# Altium schematic sheet FPGA.SchDoc: =DocumentName
size A4; DocumentNumber: 1; Revision: 0; SheetNumber: 15; SheetTotal: 30
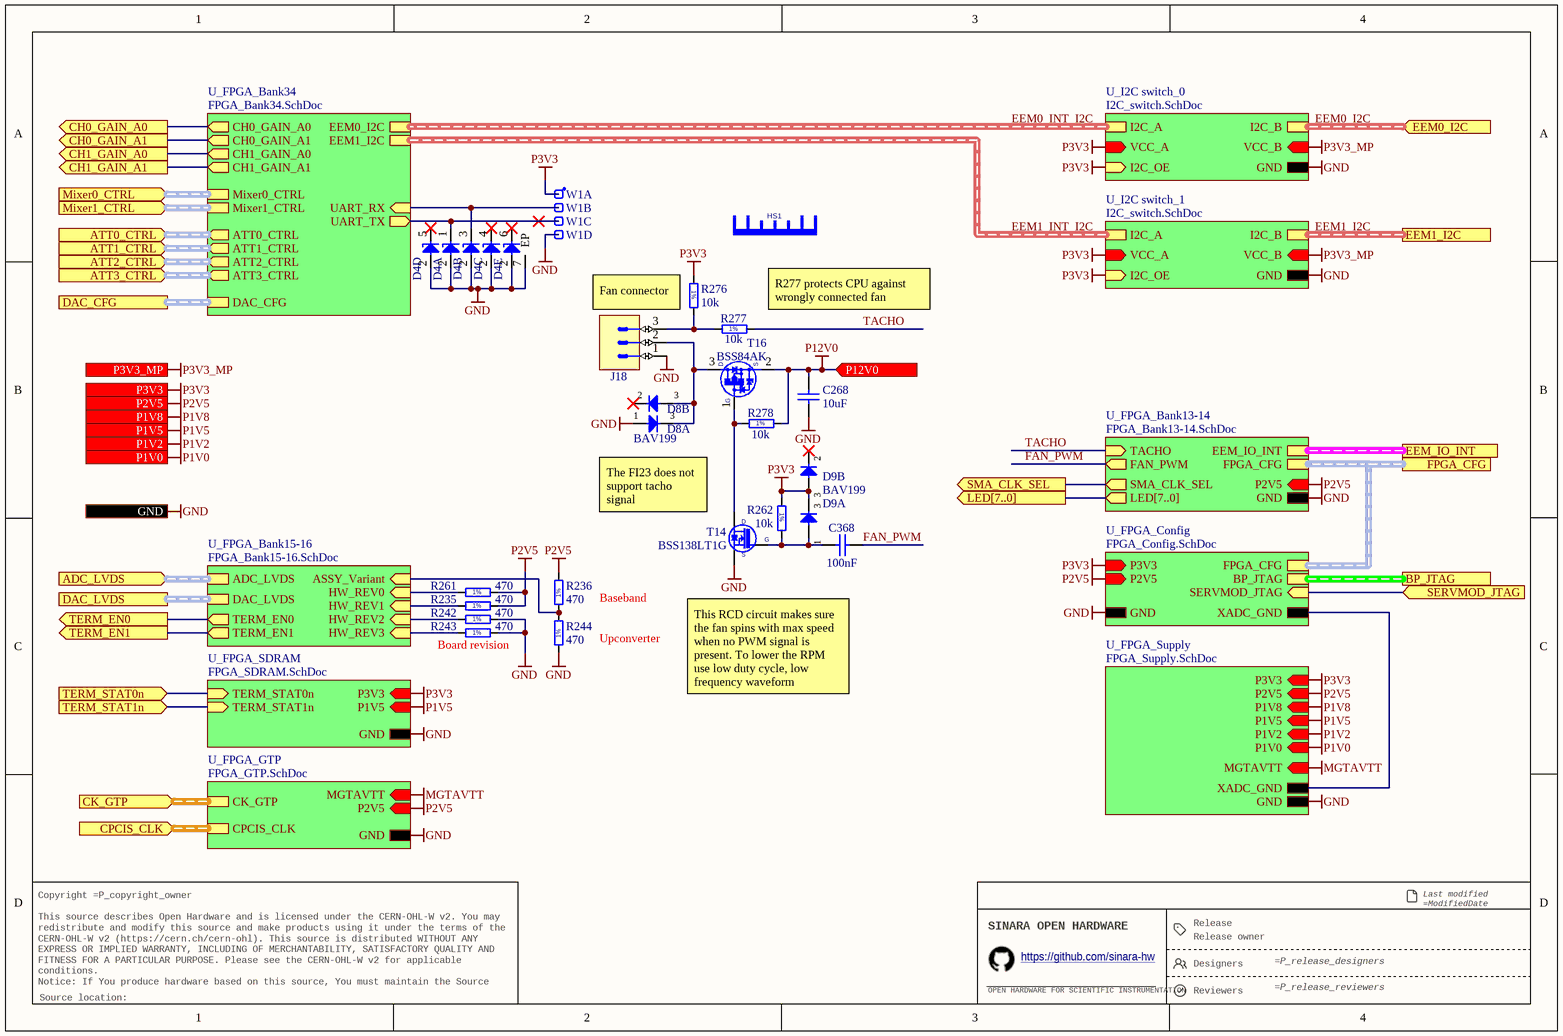
[diagram p0: FPGA.SchDoc]

## Parts
C268  10uF  [CAPC2012X95N]
C368  100nF  [CAPC0603X33N]
D4  UCLAMP3305P.TCT  [SON50P160X65_HS-7N]  (value not drawn)  (parts A,B,C,D,E of 5)
D8  BAV199  [SOT95P240X110-3N]  (parts A,B of 2)
D9  BAV199  [SOT95P240X110-3N]  (parts A,B of 2)
HS1  RADIAN_FI23  [RADIAN_FI23]  (value not drawn)
J18  KK®  [MOLEX_22-27-2031]  (value not drawn)
R235  470  [RESC1005X40N]
R236  470  [RESC1005X40N]
R242  470  [RESC1005X40N]
R243  470  [RESC1005X40N]
R244  470  [RESC1005X40N]
R261  470  [RESC1005X40N]
R262  10k  [RESC1005X40N]
R276  10k  [RESC1005X40N]
R277  10k  [RESC1005X40N]
R278  10k  [RESC1005X40N]
T14  BSS138LT1G  [SOT95P240X110-3N]
T16  BSS84AK  [SOT95P230X110-3N]
W1  Header 4  [SAMTEC_HTSW-104-23-L-S]  (value not drawn)  (parts A,B,C,D of 4)

## Sub-sheets
U_FPGA_Bank13-14 = FPGA_Bank13-14.SchDoc: GND, P2V5 (in), SMA_CLK_SEL (out), EEM_IO_INT (harness EEM_LVDS), FPGA_CFG (harness FPGA_CFG), TACHO (in), FAN_PWM (out), LED[7..0] (out)
U_FPGA_Bank15-16 = FPGA_Bank15-16.SchDoc: DAC_LVDS (harness DAC_LVDS), ADC_LVDS (harness ADC_LVDS), ASSY_Variant (in), HW_REV1 (in), HW_REV2 (in), HW_REV0 (in), HW_REV3 (in), TERM_EN0 (out), TERM_EN1 (out)
U_FPGA_Bank34 = FPGA_Bank34.SchDoc: CH0_GAIN_A0 (out), CH0_GAIN_A1 (out), CH1_GAIN_A0 (out), CH1_GAIN_A1 (out), Mixer1_CTRL (harness Mixer_CTRL), Mixer0_CTRL (harness Mixer_CTRL), ATT0_CTRL (out, harness ATT_CTRL), DAC_CFG (harness DAC_CFG), EEM1_I2C (harness I2C), EEM0_I2C (harness I2C), UART_RX (in), UART_TX (out), ATT1_CTRL (out, harness ATT_CTRL), ATT2_CTRL (out, harness ATT_CTRL), ATT3_CTRL (out, harness ATT_CTRL)
U_FPGA_Config = FPGA_Config.SchDoc: GND, XADC_GND, SERVMOD_JTAG (in), FPGA_CFG (harness FPGA_CFG), BP_JTAG (harness BP_JTAG), P3V3 (in), P2V5 (in)
U_FPGA_GTP = FPGA_GTP.SchDoc: GND, MGTAVTT (in), P2V5 (in), CK_GTP (harness CLK_DIFF), CPCIS_CLK (harness CLK_DIFF)
U_FPGA_SDRAM = FPGA_SDRAM.SchDoc: GND, P3V3 (in), P1V5 (in), TERM_STAT0n (in), TERM_STAT1n (in)
U_FPGA_Supply = FPGA_Supply.SchDoc: P3V3 (in), P1V8 (in), P1V5 (in), P2V5 (in), P1V2 (in), P1V0 (in), GND, MGTAVTT (in), XADC_GND
U_I2C switch_0 = I2C_switch.SchDoc: I2C_A (harness I2C), I2C_B (harness I2C), I2C_OE (in), GND, VCC_A (in), VCC_B (in)
U_I2C switch_1 = I2C_switch.SchDoc: I2C_A (harness I2C), I2C_B (harness I2C), I2C_OE (in), GND, VCC_A (in), VCC_B (in)

## Ports
ADC_LVDS (in, harness ADC_LVDS), ATT0_CTRL (in, harness ATT_CTRL), ATT1_CTRL (in, harness ATT_CTRL), ATT2_CTRL (in, harness ATT_CTRL), ATT3_CTRL (in, harness ATT_CTRL), BP_JTAG (harness BP_JTAG), CH0_GAIN_A0 (out), CH0_GAIN_A1 (out), CH1_GAIN_A0 (out), CH1_GAIN_A1 (out), CK_GTP (in, harness CLK_DIFF), CPCIS_CLK (in, harness CLK_DIFF), DAC_CFG (harness DAC_CFG), DAC_LVDS (harness DAC_LVDS), EEM0_I2C (in, harness I2C), EEM1_I2C (harness I2C), EEM_IO_INT (harness EEM_LVDS), FPGA_CFG (harness FPGA_CFG), GND, LED[7..0] (out), Mixer0_CTRL (in, harness Mixer_CTRL), Mixer1_CTRL (in, harness Mixer_CTRL), P1V0 (in), P1V2 (in), P1V5 (in), P1V8 (in), P2V5 (in), P3V3 (in), P3V3_MP (in), P12V0 (in), SERVMOD_JTAG (in), SMA_CLK_SEL (out), TERM_EN0 (out), TERM_EN1 (out), TERM_STAT0n (in), TERM_STAT1n (in)

## Nets
GND: C268.1 D4.2(A) D4.7(EP) D8.1(A) J18.1 R242.2 R243.2 R244.1 T14.2(S) W1.4 ; port GND, sheet U_FPGA_Bank13-14/GND, sheet U_FPGA_Supply/GND, sheet U_FPGA_Config/GND, sheet U_FPGA_SDRAM/GND, sheet U_FPGA_GTP/GND, sheet U_I2C switch_0/GND, sheet U_I2C switch_1/GND
MGTAVTT: sheet U_FPGA_Supply/MGTAVTT, sheet U_FPGA_GTP/MGTAVTT
P1V0: port P1V0, sheet U_FPGA_Supply/P1V0
P1V2: port P1V2, sheet U_FPGA_Supply/P1V2
P1V5: port P1V5, sheet U_FPGA_Supply/P1V5, sheet U_FPGA_SDRAM/P1V5
P1V8: port P1V8, sheet U_FPGA_Supply/P1V8
P2V5: R235.2 R236.2 R261.2 ; port P2V5, sheet U_FPGA_Bank13-14/P2V5, sheet U_FPGA_Supply/P2V5, sheet U_FPGA_Config/P2V5, sheet U_FPGA_GTP/P2V5
P3V3: D9.3(COMAC) R262.1 R276.1 W1.1 ; port P3V3, sheet U_FPGA_Supply/P3V3, sheet U_FPGA_Config/P3V3, sheet U_FPGA_SDRAM/P3V3, sheet U_I2C switch_0/I2C_OE, sheet U_I2C switch_0/VCC_A, sheet U_I2C switch_1/I2C_OE, sheet U_I2C switch_1/VCC_A
P3V3_MP: port P3V3_MP, sheet U_I2C switch_0/VCC_B, sheet U_I2C switch_1/VCC_B
P12V0: C268.2 R278.1 T16.2(S) ; port P12V0
CH0_GAIN_A0: port CH0_GAIN_A0, sheet U_FPGA_Bank34/CH0_GAIN_A0
CH0_GAIN_A1: port CH0_GAIN_A1, sheet U_FPGA_Bank34/CH0_GAIN_A1
CH1_GAIN_A0: port CH1_GAIN_A0, sheet U_FPGA_Bank34/CH1_GAIN_A0
CH1_GAIN_A1: port CH1_GAIN_A1, sheet U_FPGA_Bank34/CH1_GAIN_A1
FAN_PWM: C368.2 ; sheet U_FPGA_Bank13-14/FAN_PWM
SERVMOD_JTAG: port SERVMOD_JTAG, sheet U_FPGA_Config/SERVMOD_JTAG
SMA_CLK_SEL: port SMA_CLK_SEL, sheet U_FPGA_Bank13-14/SMA_CLK_SEL
TACHO: R277.2 ; sheet U_FPGA_Bank13-14/TACHO
TERM_EN0: port TERM_EN0, sheet U_FPGA_Bank15-16/TERM_EN0
TERM_EN1: port TERM_EN1, sheet U_FPGA_Bank15-16/TERM_EN1
TERM_STAT0n: port TERM_STAT0n, sheet U_FPGA_SDRAM/TERM_STAT0n
TERM_STAT1n: port TERM_STAT1n, sheet U_FPGA_SDRAM/TERM_STAT1n
NetC368_1: C368.1 D9.1(A) R262.2 T14.1(G)
NetD4_1: D4.1(C) W1.3 ; sheet U_FPGA_Bank34/UART_TX
NetD4_3: D4.3(C) W1.2 ; sheet U_FPGA_Bank34/UART_RX
NetD8_3: D8.3(COMAC) J18.2 T16.3(D)
NetJ18_3: J18.3 R276.2 R277.1
NetR235_1: R235.1 ; sheet U_FPGA_Bank15-16/HW_REV1
NetR236_1: R236.1 R244.2 ; sheet U_FPGA_Bank15-16/ASSY_Variant
NetR242_1: R242.1 ; sheet U_FPGA_Bank15-16/HW_REV2
NetR243_1: R243.1 ; sheet U_FPGA_Bank15-16/HW_REV3
NetR261_1: R261.1 ; sheet U_FPGA_Bank15-16/HW_REV0
NetR278_2: R278.2 T14.3(D) T16.1(G)
(unnamed): sheet U_FPGA_Supply/XADC_GND, sheet U_FPGA_Config/XADC_GND

Not connected (* = marked no-connect by the designer): D4 4(C)* 5(C)* 6(C)*; D8 2(C)*; D9 2(C)*

## Buses and harness runs
bus port LED[7..0] = sheet U_FPGA_Bank13-14/LED[7..0]
harness EEM0_I2C = port EEM0_I2C = sheet U_I2C switch_0/I2C_B
harness EEM0_INT_I2C = sheet U_FPGA_Bank34/EEM0_I2C = sheet U_I2C switch_0/I2C_A
harness EEM1_I2C = port EEM1_I2C = sheet U_I2C switch_1/I2C_B
harness EEM1_INT_I2C = sheet U_FPGA_Bank34/EEM1_I2C = sheet U_I2C switch_1/I2C_A
harness port ADC_LVDS = sheet U_FPGA_Bank15-16/ADC_LVDS
harness port ATT0_CTRL = sheet U_FPGA_Bank34/ATT0_CTRL
harness port ATT1_CTRL = sheet U_FPGA_Bank34/ATT1_CTRL
harness port ATT2_CTRL = sheet U_FPGA_Bank34/ATT2_CTRL
harness port ATT3_CTRL = sheet U_FPGA_Bank34/ATT3_CTRL
harness port BP_JTAG = sheet U_FPGA_Config/BP_JTAG
harness port CK_GTP = sheet U_FPGA_GTP/CK_GTP
harness port CPCIS_CLK = sheet U_FPGA_GTP/CPCIS_CLK
harness port DAC_CFG = sheet U_FPGA_Bank34/DAC_CFG
harness port DAC_LVDS = sheet U_FPGA_Bank15-16/DAC_LVDS
harness port EEM_IO_INT = sheet U_FPGA_Bank13-14/EEM_IO_INT
harness port FPGA_CFG = sheet U_FPGA_Bank13-14/FPGA_CFG = sheet U_FPGA_Config/FPGA_CFG
harness port Mixer0_CTRL = sheet U_FPGA_Bank34/Mixer0_CTRL
harness port Mixer1_CTRL = sheet U_FPGA_Bank34/Mixer1_CTRL

## Notes on the sheet
- Fan connector
- R277 protects CPU against wrongly connected fan
- The FI23 does not support tacho signal
- (near R243) Board revision
- Baseband
- Upconverter
- This RCD circuit makes sure the fan spins with max speed when no PWM signal is present. To lower the RPM use low duty cycle, low frequency waveform
- Release
- Last modified =ModifiedDate
  Sheet =sheetnumber of =sheettotal · Size A4
- Copyright =P_copyright_owner
  This source describes Open Hardware and is licensed under the CERN-OHL-W v2. You may redistribute and modify this source and make products using it under the terms of the CERN-OHL-W v2 (https://cern.ch/cern-ohl). This source is distributed WITHOUT ANY EXPRESS OR IMPLIED WARRANTY, INCLUDING OF MERCHANTABILITY, SATISFACTORY QUALITY AND FITNESS FOR A PARTICULAR PURPOSE. Please see the CERN-OHL-W v2 for applicable conditions.
  Notice: If You produce hardware based on this source, You must maintain the Source Location visible on the product, its packaging or its documentation.
- SINARA OPEN HARDWARE
- OPEN HARDWARE FOR SCIENTIFIC INSTRUMENTATION
- https://github.com/sinara-hw
- Release owner
- Designers
- Reviewers
- Source location:
- (in symbol R0402_10K_1%_0.0625W_100PPM) 1%
- (in symbol R0402_470R_1%_0.0625W_100PPM) 1%

## Library data of the parts
C268 = CC0805_10UF_25V_10%_X5R: Non-polarised capacitor; Part Description: SMD Multilayer Chip Ceramic Capacitor; Manufacturer: GENERIC; Manufacturer1 Part Number: GRM219R61E106KA12D; Voltage: 25V; TC: X5R; Tolerance: ±10%; Part Number: CC0805_10UF_25V_10%_X5R; Component Kind: Standard; Component Type: Standard; Pin Count: 2; Value: 10uF; Status: Preferred; Manufacturer Part Number: CC0805_10UF_25V_10%_X5R; Case: 0805; Mounted: Yes; Socket: No; SMD: Yes; Sense: No; Manufacturer1 Example: MURATA; Manufacturer1 ComponentHeight: 0.95mm; HelpURL: \\cern.ch\dfs\Applications\Altium\Datasheets\CC0805_X5R_MURATA_GRM.pdf; Author: CERN DEM JLC; CreateDate: 25.10.2012; LatestRevisionDate: 06.09.2016
C368 = CC0201_100NF_6.3V_10%_X5R: Non-polarised capacitor; Part Description: SMD Multilayer Chip Ceramic Capacitor; Manufacturer: GENERIC; Manufacturer1 Part Number: 02016D104KAT2A; Voltage: 6.3V; TC: X5R; Tolerance: ±10%; Part Number: CC0201_100NF_6.3V_10%_X5R; Component Kind: Standard; Component Type: Standard; Pin Count: 2; Value: 100nF; Status: Not Recommended; Manufacturer Part Number: CC0201_100NF_6.3V_10%_X5R; Case: 0201; Mounted: Yes; Socket: No; SMD: Yes; Sense: No; Manufacturer1 Example: AVX; Manufacturer1 ComponentHeight: 0.33mm; HelpURL: \\cern.ch\dfs\Applications\Altium\Datasheets\CC0201_X5R_AVX.pdf; Author: CERN DEM JLC; CreateDate: 2007-12-03; LatestRevisionDate: 2007-12-03; ClassName: FPGA_JTAG
D4 = CMP-004-00037-2: Diode TVS Quint Common Anode Uni-Dir 3.3V 40W 6-Pin SLP EP T/R; Max Operating Temperature: 125°C; Min Operating Temperature: -55°C; Pins: 6; Mounting Technology: Surface Mount
D8 D9 = BAV199: Serial Diode; Part Description: Low-Leakage Double Diode; Manufacturer: NXP SEMICONDUCTORS; Voltage: 75V; Power: 250mW; PressFit: No; Bonding: No; Part Number: BAV199; Component Kind: Standard; Component Type: Standard; Device: BAV199; PackageDescription: SOT23 3-Leads, Pitch 0.95mm - Body 1.4x3mm, IPC Medium Density; Manufacturer Part Number: BAV199; Pin Count: 3; Case: SOT23-3; Mounted: Yes; Socket: No; SMD: Yes; Sense: No; ComponentHeight: 1.1mm; HelpURL: \\cern.ch\dfs\Applications\Altium\Datasheets\BAV199.pdf; Author: CERN DEM JMW; CreateDate: 2008-11-21; LatestRevisionDate: 2008-11-21
HS1 = RADIAN_FI23: Heat Sink Without Pad; Manufacturer: Radian Thermal Products, Inc.; Manufacturer Part Number: FI23+BU+T725; Part Description: 23 x 23 x 16 mm, clip on heatsink with fan for IC design BGA and others; ComponentHeight: 16 mm; HelpURL: https://www.radianheatsinks.com/product/fi23/
J18 = MOLEX_22-27-2031: Connector 3 Male; Part Description: 2.54mm (.100") Pitch KK® Wire-to-Board Header, Vertical, with Friction Lock, 3 Circuits, Tin (Sn) Plating; Manufacturer: MOLEX; PressFit: No; Part Number: MOLEX_22-27-2031; Component Kind: Standard; Component Type: Standard; Pin Count: 3; Family: KK®; Mounted: Yes; Socket: No; SMD: No; Sense: No; Status: None; Manufacturer Part Number: 22-27-2031; ComponentHeight: 11.7mm; HelpURL: \\cern.ch\dfs\Applications\Altium\Datasheets\MOLEX_22-27-2031.pdf; Author: CERN DEM JLC; CreateDate: 04.12.2008; LatestRevisionDate: 04.12.2008
R235 R236 R242-R244 R261 = R0402_470R_1%_0.0625W_100PPM: Resistor - 1%; Part Description: General Purpose Thick Film Chip Resistor; Manufacturer: GENERIC; Manufacturer1 Part Number: 232270674701L; TC: ±100ppm/°C; PressFit: No; Part Number: R0402_470R_1%_0.0625W_100PPM; Component Kind: Standard; Component Type: Standard; Pin Count: 2; Value: 470; Status: Not Recommended; Power: 0.0625W; Tolerance: ±1%; Manufacturer Part Number: R0402_470R_1%_0.0625W_100PPM; Case: 0402; Mounted: Yes; Sense: No; Socket: No; SMD: Yes; Manufacturer1 Example: YAGEO PHYCOMP; Manufacturer1 ComponentHeight: 0.4mm; HelpURL: \\cern.ch\dfs\Applications\Altium\Datasheets\R0402_Phycomp_RC0402.pdf; Author: CERN DEM JLC; CreateDate: 03.12.2007; LatestRevisionDate: 17.10.2012
R262 = R0402_10K_1%_0.0625W_100PPM: Resistor - 1%; Part Description: General Purpose Thick Film Chip Resistor; Manufacturer: GENERIC; Manufacturer1 Part Number: 232270671003L; TC: ±100ppm/°C; Part Number: R0402_10K_1%_0.0625W_100PPM; Component Kind: Standard; Component Type: Standard; Pin Count: 2; Value: 10k; Status: Not recommended; Power: 0.0625W; Tolerance: ±1%; Manufacturer Part Number: R0402_10K_1%_0.0625W_100PPM; Case: 0402; Mounted: Yes; Sense: No; Socket: No; SMD: Yes; Manufacturer1 Example: YAGEO PHYCOMP; Manufacturer1 ComponentHeight: 0.4mm; HelpURL: \\cern.ch\dfs\Applications\Altium\Datasheets\R0402_Phycomp_RC0402.pdf; Author: CERN DEM JLC; CreateDate: 03.12.2007; LatestRevisionDate: 17.10.2012
R276-R278 = R0402_10K_1%_0.0625W_100PPM: Resistor - 1%; Part Description: General Purpose Thick Film Chip Resistor; Manufacturer: GENERIC; Manufacturer1 Part Number: 232270671003L; TC: ±100ppm/°C; PressFit: No; Part Number: R0402_10K_1%_0.0625W_100PPM; Component Kind: Standard; Component Type: Standard; Pin Count: 2; Value: 10k; Status: Not Recommended; Power: 0.0625W; Tolerance: ±1%; Manufacturer Part Number: R0402_10K_1%_0.0625W_100PPM; Case: 0402; Mounted: Yes; Sense: No; Socket: No; SMD: Yes; Manufacturer1 Example: YAGEO PHYCOMP; Manufacturer1 ComponentHeight: 0.4mm; HelpURL: \\cern.ch\dfs\Applications\Altium\Datasheets\R0402_Phycomp_RC0402.pdf; Author: CERN DEM JLC; CreateDate: 03.12.2007; LatestRevisionDate: 17.10.2012
T14 = BSS138LT1G: N-CHANNEL MOSFET WITH DIODE; Part Description: 50V 200mA N-Channel Enhancement Mode Field-Effect Transistor; Manufacturer: ON SEMICONDUCTOR; PressFit: No; Bonding: No; Part Number: BSS138LT1G; Component Kind: Standard; Component Type: Standard; Device: BSS138LT1G; PackageDescription: SOT23, 0.95mm Pitch; 3 Pin, 1.40mm W X 3.00mm L X 1.10mm H body, IPC Medium Density; Manufacturer Part Number: BSS138LT1G; Pin Count: 3; Case: SOT23-3; Mounted: Yes; Socket: No; SMD: Yes; Sense: No; ComponentHeight: 1.11mm; HelpURL: \\cern.ch\dfs\Applications\Altium\Datasheets\BSS138LT1G.pdf; Author: CERN DEM JLC; CreateDate: 23.03.2009; LatestRevisionDate: 23.03.2009
T16 = BSS84AK: 50V, 180mA P-Channel Trench MOSFET; Part Description: 50V, 180mA P-channel Trench MOSFET Transistor; Manufacturer: NXP SEMICONDUCTORS; PressFit: No; Bonding: No; Part Number: BSS84AK; Component Kind: Standard; Component Type: Standard; Device: BSS84AK; PackageDescription: SOT23, 0.95mm Pitch; 3 Pin, 1.30mm W X 2.90mm L X 1.10mm H body, IPC Medium Density; Manufacturer Part Number: BSS84AK; Pin Count: 3; Case: SOT23-3; Mounted: Yes; Socket: No; SMD: Yes; Sense: No; ComponentHeight: 1.1mm; HelpURL: \\cern.ch\dfs\Applications\Altium\Datasheets\BSS84AK.pdf; Author: CERN DEM JLC; CreateDate: 16.04.2015; LatestRevisionDate: 16.04.2015
W1 = SAMTEC_HTSW-104-23-L-S: 4 Mini Wire-Wrap Contact Strip Header; Part Description: 4 Contacts, Pitch 2.54mm, Single Row  Through Mount Straight Header (Post Lead 5.84mm, Tail Lead 2.92mm, Insulator 2.54mm); Manufacturer: SAMTEC; PressFit: No; Status Comment: High Temperature; Part Number: SAMTEC_HTSW-104-23-L-S; Component Kind: Standard; Component Type: Standard; Pin Count: 4; Family: Header 4; Mounted: Yes; Socket: No; Sense: No; SMD: No; Status: Preferred; Manufacturer Part Number: HTSW-104-23-L-S; ComponentHeight: 8.38mm; HelpURL: \\cern.ch\dfs\Applications\Altium\Datasheets\SAMTEC_HTSW-104-23-L-S.pdf; Author: CERN DEM JLC; CreateDate: 22/02/2018; LatestRevisionDate: 22/02/2018